# Altium schematic sheet VCA.SchDoc
size A2; SheetNumber: 1; SheetTotal: 1
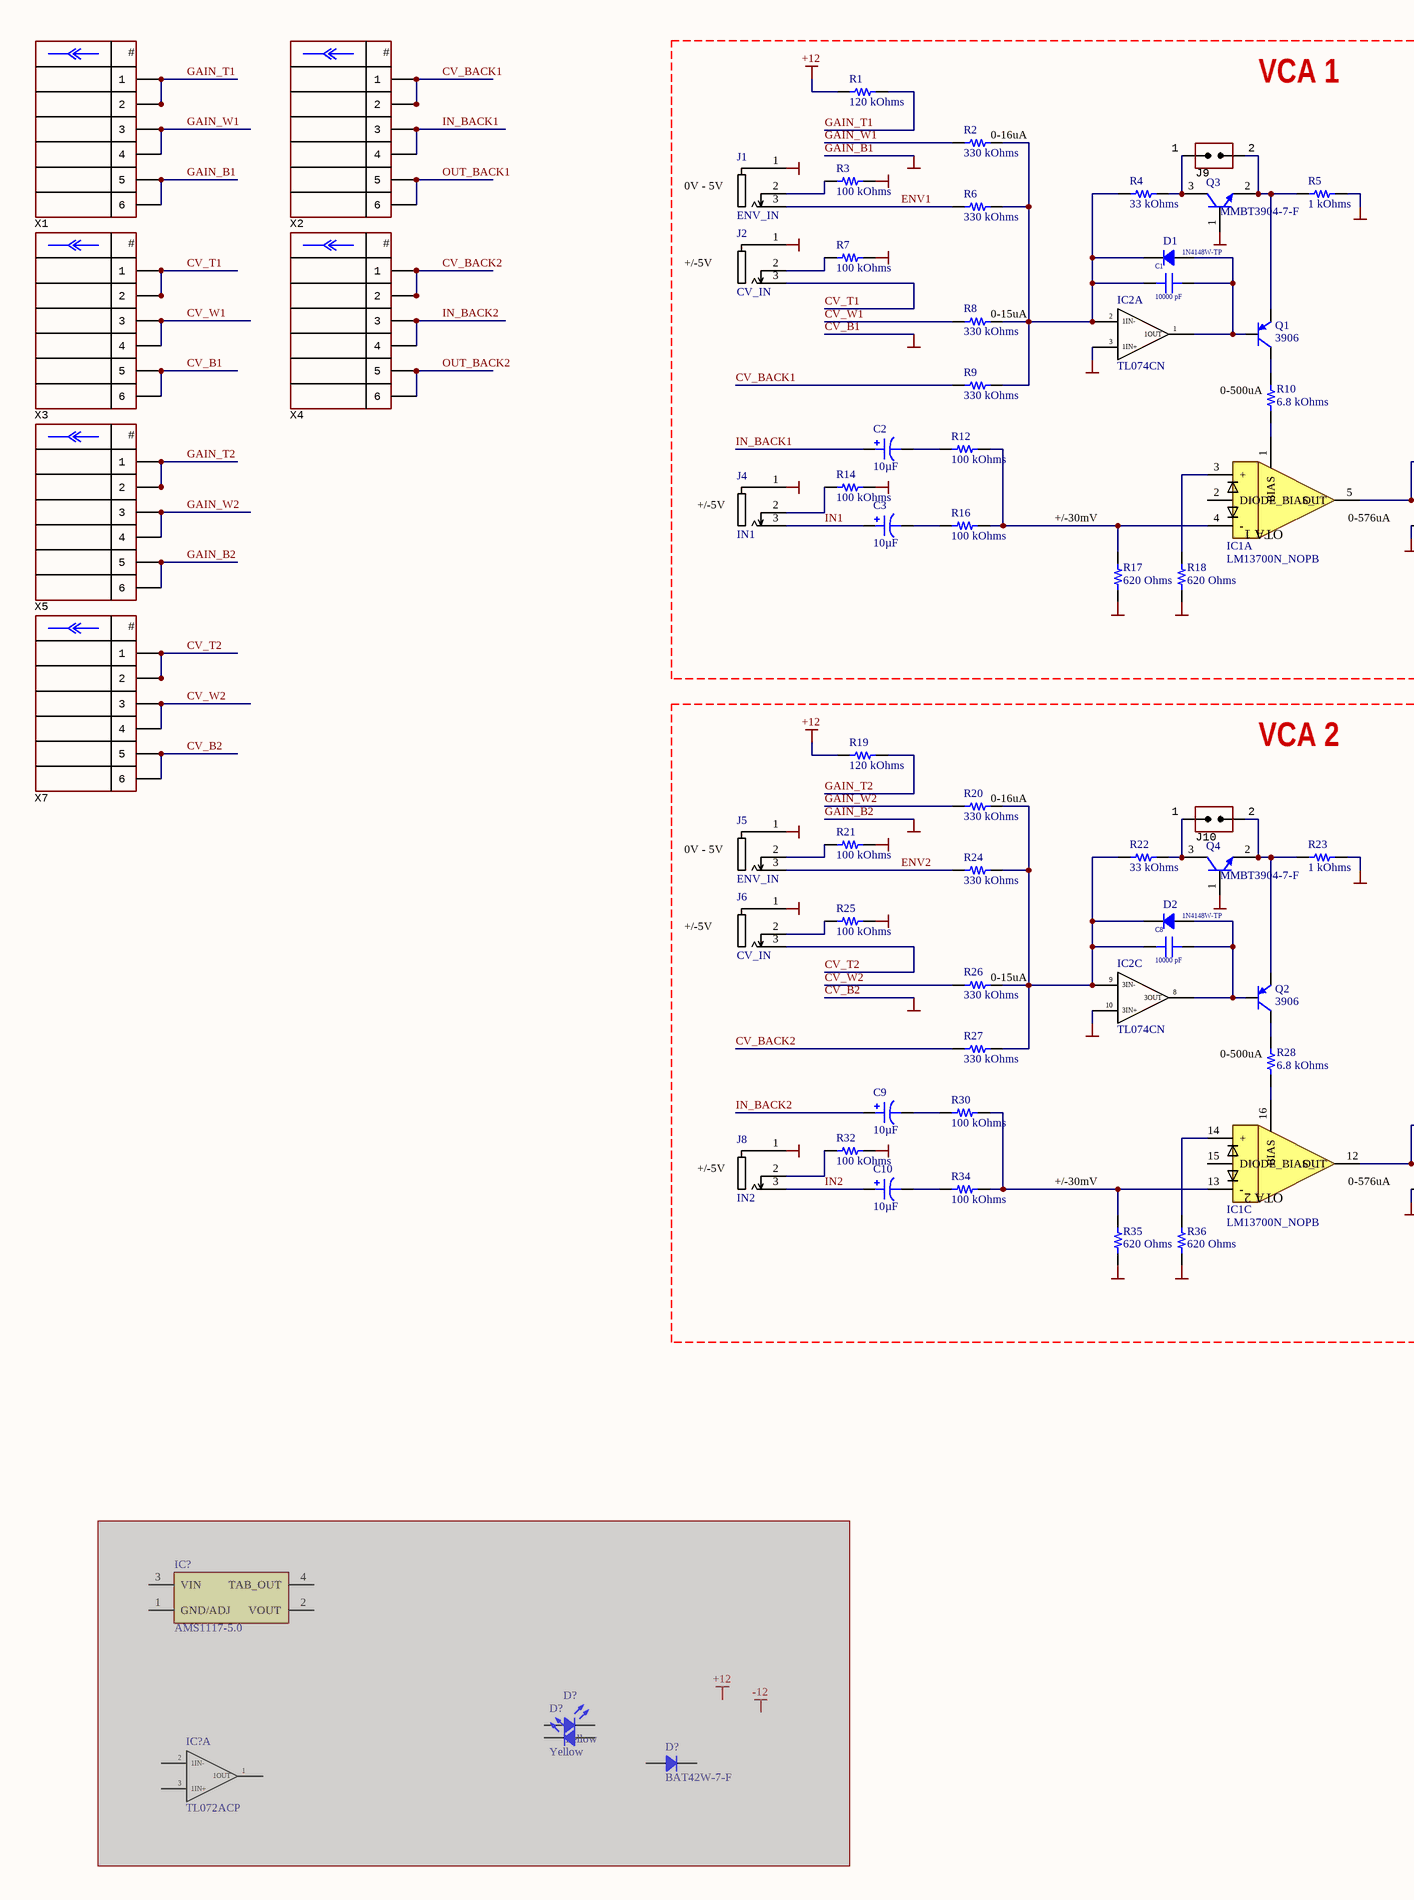
[diagram p0: VCA.SchDoc, left]
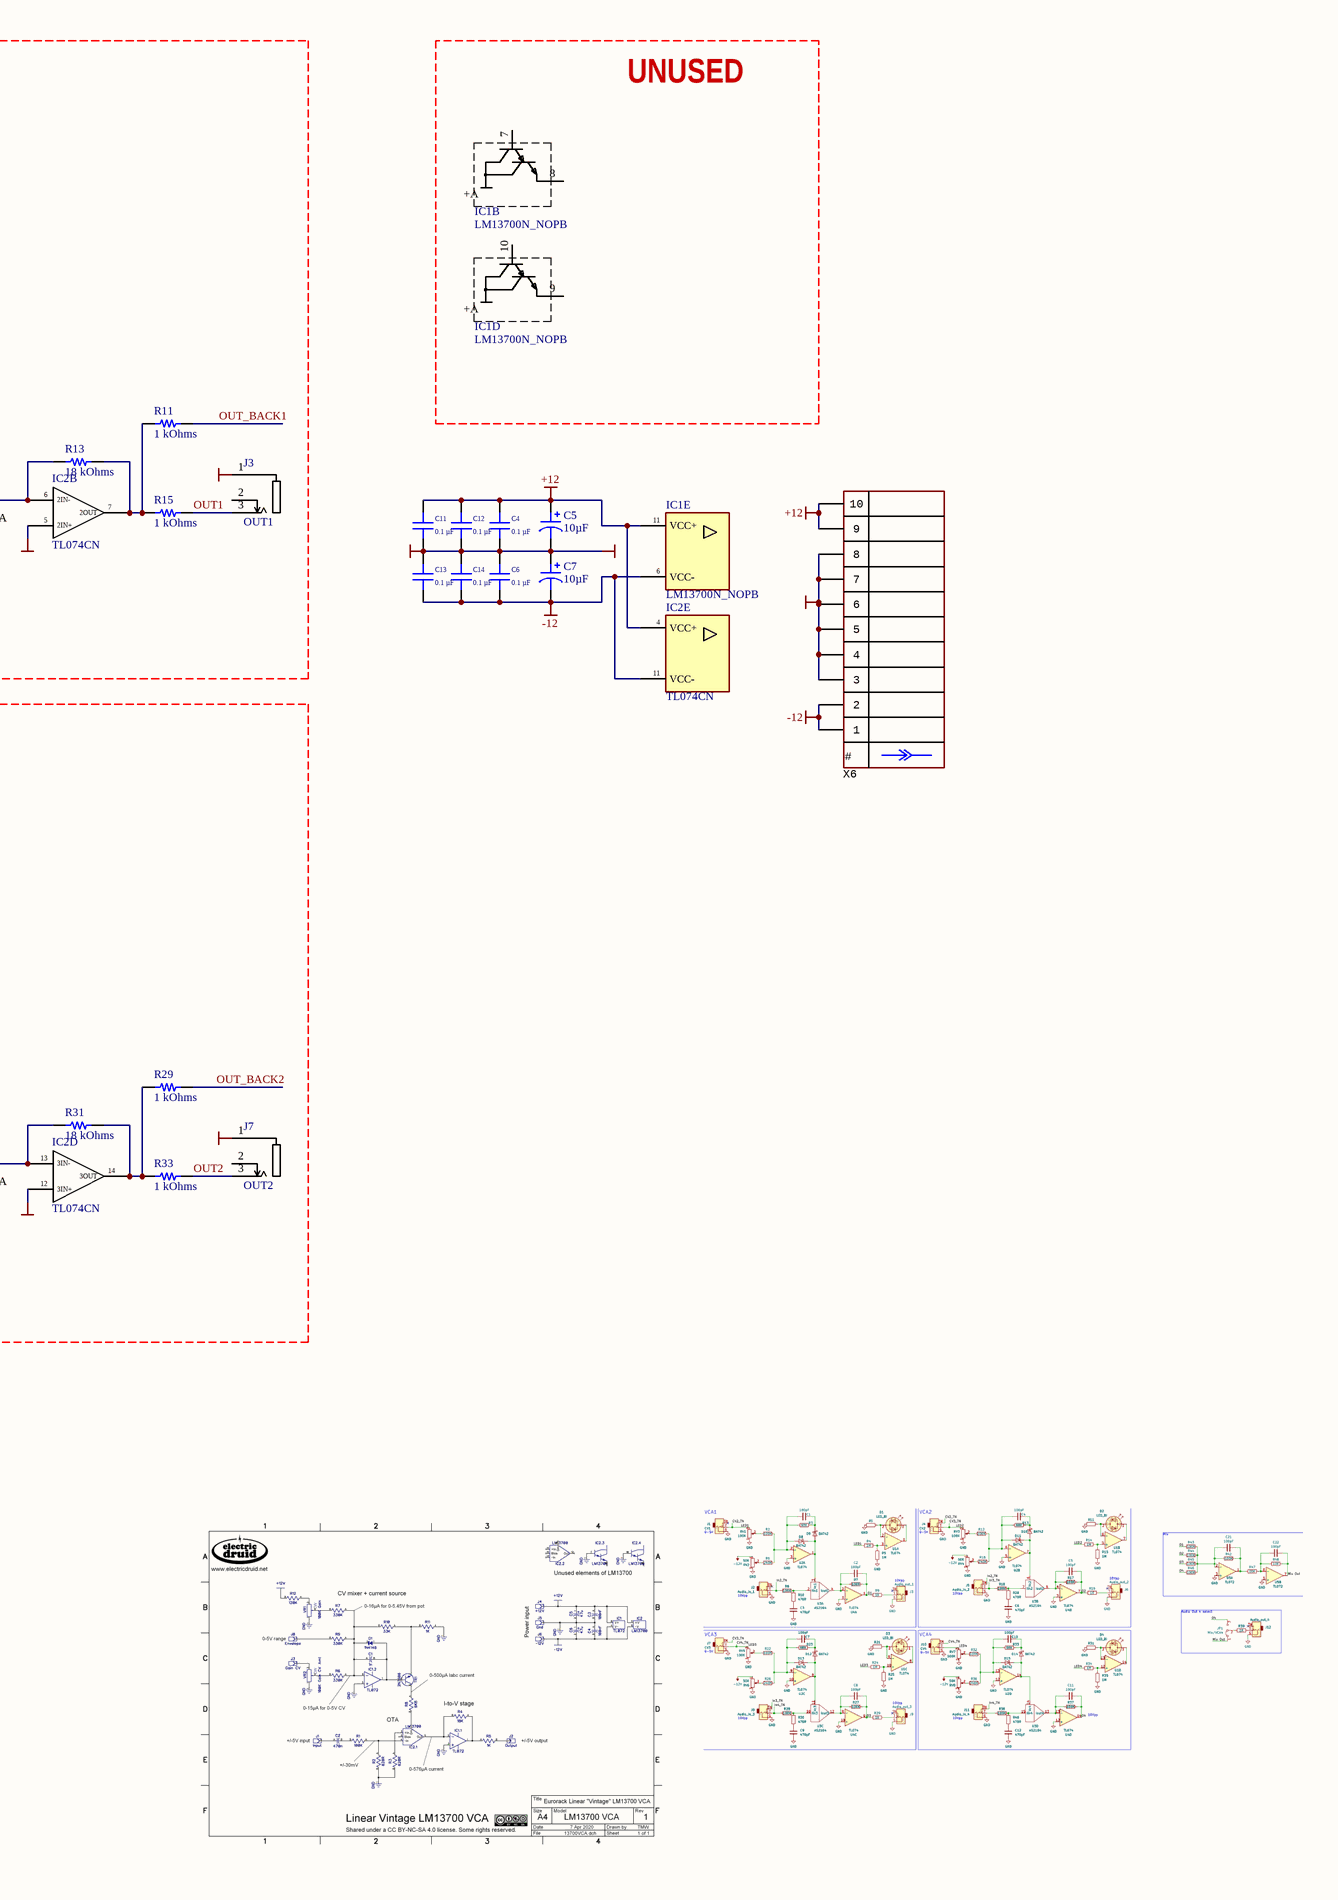
[diagram p1: VCA.SchDoc, right]

## Parts
(Parts that share a designator on the sheet are numbered #1, #2 ... from top to bottom, then left to right.)
C1  10000 pF  [MURATA GRM188 0603_1608]
C2  10µF  [CAP POL 1411_3528]
C3  10µF  [CAP POL 1411_3528]
C4  0.1 µF  [CAP 0603_1608]
C5  10µF  [CAP POL 1411_3528]
C6  0.1 µF  [CAP 0603_1608]
C7  10µF  [CAP POL 1411_3528]
C8  10000 pF  [MURATA GRM188 0603_1608]
C9  10µF  [CAP POL 1411_3528]
C10  10µF  [CAP POL 1411_3528]
C11  0.1 µF  [CAP 0603_1608]
C12  0.1 µF  [CAP 0603_1608]
C13  0.1 µF  [CAP 0603_1608]
C14  0.1 µF  [CAP 0603_1608]
D1  1N4148W-TP  [SOD-123]
D2  1N4148W-TP  [SOD-123]
D?#1  Yellow  [LED 0805_2012 YELLOW]  (masked out: inside a compile mask, not in the netlist)
D?#2  Yellow  [LED 0805_2012 YELLOW]  (masked out: inside a compile mask, not in the netlist)
D?#3  BAT42W-7-F  [SOD-123]  (masked out: inside a compile mask, not in the netlist)
IC1  LM13700N_NOPB  [DIP_SMD-16]  (parts A,B,C,D,E of 5)
IC2  TL074CN  [DIP_SMD-14]  (parts A,B,C,D,E of 5)
IC?#1  AMS1117-5.0  [SOT-223]  (masked out: inside a compile mask, not in the netlist)
IC?#2  TL072ACP  [SOIC-8]  (part A of 3)  (masked out: inside a compile mask, not in the netlist)
J1  ENV_IN  [THONKICONN]
J2  CV_IN  [THONKICONN]
J3  OUT1  [THONKICONN]
J4  IN1  [THONKICONN]
J5  ENV_IN  [THONKICONN]
J6  CV_IN  [THONKICONN]
J7  OUT2  [THONKICONN]
J8  IN2  [THONKICONN]
J9  (no value)  [CON: JUMPER x1]
J10  (no value)  [CON: JUMPER x1]
Q1  3906  [SOT-23]
Q2  3906  [SOT-23]
Q3  MMBT3904-7-F  [DIODES SOT-23-3]
Q4  MMBT3904-7-F  [DIODES SOT-23-3]
R1  120 kOhms  [YAGEO RES 0603_1608]
R2  330 kOhms  [YAGEO RES 0603_1608]
R3  100 kOhms  [YAGEO RES 0603_1608]
R4  33 kOhms  [YAGEO RES 0603_1608]
R5  1 kOhms  [YAGEO RES 0603_1608]
R6  330 kOhms  [YAGEO RES 0603_1608]
R7  100 kOhms  [YAGEO RES 0603_1608]
R8  330 kOhms  [YAGEO RES 0603_1608]
R9  330 kOhms  [YAGEO RES 0603_1608]
R10  6.8 kOhms  [YAGEO RES 0603_1608]
R11  1 kOhms  [YAGEO RES 0603_1608]
R12  100 kOhms  [YAGEO RES 0603_1608]
R13  18 kOhms  [YAGEO RES 0603_1608]
R14  100 kOhms  [YAGEO RES 0603_1608]
R15  1 kOhms  [YAGEO RES 0603_1608]
R16  100 kOhms  [YAGEO RES 0603_1608]
R17  620 Ohms  [YAGEO RES 0603_1608]
R18  620 Ohms  [YAGEO RES 0603_1608]
R19  120 kOhms  [YAGEO RES 0603_1608]
R20  330 kOhms  [YAGEO RES 0603_1608]
R21  100 kOhms  [YAGEO RES 0603_1608]
R22  33 kOhms  [YAGEO RES 0603_1608]
R23  1 kOhms  [YAGEO RES 0603_1608]
R24  330 kOhms  [YAGEO RES 0603_1608]
R25  100 kOhms  [YAGEO RES 0603_1608]
R26  330 kOhms  [YAGEO RES 0603_1608]
R27  330 kOhms  [YAGEO RES 0603_1608]
R28  6.8 kOhms  [YAGEO RES 0603_1608]
R29  1 kOhms  [YAGEO RES 0603_1608]
R30  100 kOhms  [YAGEO RES 0603_1608]
R31  18 kOhms  [YAGEO RES 0603_1608]
R32  100 kOhms  [YAGEO RES 0603_1608]
R33  1 kOhms  [YAGEO RES 0603_1608]
R34  100 kOhms  [YAGEO RES 0603_1608]
R35  620 Ohms  [YAGEO RES 0603_1608]
R36  620 Ohms  [YAGEO RES 0603_1608]
X1  (no value)  [CON: PBD-6]
X2  (no value)  [CON: PBD-6]
X3  (no value)  [CON: PBD-6]
X4  (no value)  [CON: PBD-6]
X5  (no value)  [CON: PBD-6]
X6  (no value)  [CON: IDC-10MS]
X7  (no value)  [CON: PBD-6]

## Blocks framed on the sheet
VCA 1: C1-C3 D1 IC1 IC2 J1-J4 J9 Q1 Q3 R1-R18
UNUSED: IC1
VCA 2: C8-C10 D2 IC1 IC2 J5-J8 J10 Q2 Q4 R19-R36

## Nets
+12: C4.2 C5.1 C11.2 C12.2 IC1.11(VCC+) IC2.4(VCC+) R1.1 R19.1 X6.9 X6.10
-12: C6.1 C7.2 C13.1 C14.1 IC1.6(VCC-) IC2.11(VCC-) X6.1 X6.2
CV_B1: C4.1 C5.2 C6.2 C7.1 C11.1 C12.1 C13.2 C14.2 IC2.3(1IN+) IC2.5(2IN+) IC2.10(3IN+) IC2.12(3IN+) J1.1 J2.1 J3.1 J4.1 J5.1 J6.1 J7.1 J8.1 Q3.1(B) Q4.1(B) R3.2 R5.2 R7.2 R14.2 R17.1 R18.1 R21.2 R23.2 R25.2 R32.2 R35.1 R36.1 X1.5 X1.6 X3.5 X3.6 X5.5 X5.6 X6.3 X6.4 X6.5 X6.6 X6.7 X6.8 X7.5 X7.6  [also labelled CV_B2, GAIN_B1, GAIN_B2, GND]
CV_BACK1: R9.1 X2.1 X2.2
CV_BACK2: R27.1 X4.1 X4.2
CV_T1: J2.3 X3.1 X3.2
CV_T2: J6.3 X7.1 X7.2
CV_W1: R8.1 X3.3 X3.4
CV_W2: R26.1 X7.3 X7.4
ENV1: J1.3 R6.1
ENV2: J5.3 R24.1
GAIN_T1: R1.2 X1.1 X1.2
GAIN_T2: R19.2 X5.1 X5.2
GAIN_W1: R2.1 X1.3 X1.4
GAIN_W2: R20.1 X5.3 X5.4
IN1: C3.1 J4.3
IN2: C10.1 J8.3
IN_BACK1: C2.1 X2.3 X2.4
IN_BACK2: C9.1 X4.3 X4.4
OUT1: J3.3 R15.2
OUT2: J7.3 R33.2
OUT_BACK1: R11.2 X2.5 X2.6
OUT_BACK2: R29.2 X4.5 X4.6
NetC1_1: C1.1 D1.1 IC2.1(1OUT) Q1.1(B)
NetC1_2: C1.2 D1.2 IC2.2(1IN-) R2.2 R4.1 R6.2 R8.2 R9.2
NetC2_2: C2.2 R12.1
NetC3_2: C3.2 R16.1
NetC8_1: C8.1 D2.1 IC2.8(3OUT) Q2.1(B)
NetC8_2: C8.2 D2.2 IC2.9(3IN-) R20.2 R22.1 R24.2 R26.2 R27.2
NetC9_2: C9.2 R30.1
NetC10_2: C10.2 R34.1
NetIC1_1: IC1.1(BIAS) R10.1
NetIC1_3: IC1.3(+) R18.2
NetIC1_4: IC1.4(-) R12.2 R16.2 R17.2
NetIC1_5: IC1.5(OUT) IC2.6(2IN-) R13.1
NetIC1_12: IC1.12(OUT) IC2.13(3IN-) R31.1
NetIC1_13: IC1.13(-) R30.2 R34.2 R35.2
NetIC1_14: IC1.14(+) R36.2
NetIC1_16: IC1.16(BIAS) R28.1
NetIC2_7: IC2.7(2OUT) R11.1 R13.2 R15.1
NetIC2_14: IC2.14(3OUT) R29.1 R31.2 R33.1
NetJ1_2: J1.2 R3.1
NetJ2_2: J2.2 R7.1
NetJ4_2: J4.2 R14.1
NetJ5_2: J5.2 R21.1
NetJ6_2: J6.2 R25.1
NetJ8_2: J8.2 R32.1
NetJ9_1: J9.1(IN) Q3.3(C) R4.2
NetJ9_2: J9.2(IN) Q1.2(E) Q3.2(E) R5.1
NetJ10_1: J10.1(IN) Q4.3(C) R22.2
NetJ10_2: J10.2(IN) Q2.2(E) Q4.2(E) R23.1
NetQ1_3: Q1.3(C) R10.2
NetQ2_3: Q2.3(C) R28.2

Not connected (* = marked no-connect by the designer): IC1 2(DIODE_BIAS_1) 7(BUFFER_INPUT_1) 8(BUFFER_OUTPUT_1) 9(BUFFER_OUTPUT_1) 10(BUFFER_INPUT_1) 15(DIODE_BIAS_1); J3 2(4); J7 2(4)

## Notes on the sheet
- (near J1) 0V - 5V
- (near R2) 0-16uA
- +/-5V
- (near R8) 0-15uA
- (near R10) 0-500uA
- (near J4) +/-5V
- (near R17) +/-30mV
- (near IC1) 0-576uA
- (near R20) 0-16uA
- (near J5) 0V - 5V
- (near R26) 0-15uA
- (near R28) 0-500uA
- (near J8) +/-5V
- (near R35) +/-30mV
- (in symbol IDC-10) #
- (in symbol LM13700N_NOPB, part A) OTA 1
- (in symbol LM13700N_NOPB, part B) V+
- (in symbol LM13700N_NOPB, part C) OTA 2
- (in symbol LM13700N_NOPB, part D) V+
- (in symbol PBD-6) #

## Library data of the parts
C1 C8 = GRM1885C1H103JA01D: CAP CER 10000PF 50V C0G/NP0 0603; manufacturer: Murata Electronics; Temperature Coefficient: C0G, NP0; Tolerance: ±5%; Part Number: GRM1885C1H103JA01D; Capacitance: 10000 pF; Applications: General Purpose; componentlink1description: Datasheet; componentlink1url: https://www.murata.com/~/media/webrenewal/support/library/catalog/products/capacitor/mlcc/c02e.ashx?la=en-us; componentlink2description: DigiKey Link; componentlink2url: https://www.digikey.com/en/products/detail/murata-electronics/GRM1885C1H103JA01D/4421555; Device Package: 0603 (1608 Metric); lastupdated: 7/20/2024 12:23:21 AM; Lifecycle Status: Active; Minimum Order: 1; Mounting Type: Surface Mount, MLCC; Operating Temperature: -55°C ~ 125°C; Package / Case: 0603 (1608 Metric); packaging: TapeAndReel; partid: 11077; Part Status: Active; price: 0.02; series: GRM; Size / Dimension: 0.063" L x 0.031" W (1.60mm x 0.80mm); Supplier 1: DigiKey; Supplier Part Number 1: 490-9666-1-ND; Thickness (Max): 0.035" (0.90mm); value: 10000 pF; Voltage - Rated: 50V
C2 C3 C5 C7 C9 C10 = TAJB106K025RNJ: CAP TANT 10UF 10% 25V 1411; manufacturer: AVX Corporation; Manufacturer Size Code: B; ESR (Equivalent Series Resistance): 2.5Ohm; Type: Molded; Part Number: TAJB106K025RNJ; Value: 10µF; Capacitance: 10µF; componentlink1description: Datasheet; componentlink1url: http://datasheets.avx.com/TAJ.pdf; componentlink2description: DigiKey Link; componentlink2url: http://digikey.com/product-detail/en/avx-corporation/TAJB106K025RNJ/478-5257-1-ND/1950924; Features: General Purpose; Height - Seated (Max): 0.083" (2.10mm); lastupdated: 9/2/2020 1:15:45 AM; Lifecycle Status: Active; Minimum Order: 1; Mounting Type: Surface Mount; Operating Temperature: -55°C ~ 125°C; Package / Case: 1411 (3528 Metric), 1210; packaging: TapeAndReel; partid: 206; Part Status: Active; price: 0.16; series: TAJ; Size / Dimension: 0.138" L x 0.110" W (3.50mm x 2.80mm); Supplier 1: DigiKey; Supplier Part Number 1: 478-5257-1-ND; Tolerance: ±10%; Voltage - Rated: 25V
C4 C6 C11-C14 = C0603C104K5RAC7411: CAP CER 0.1UF 50V X7R 0603; manufacturer: KEMET; Tolerance: ±10%; Part Number: C0603C104K5RAC7411; Value: 0.1 µF; Applications: Bypass, Decoupling; Capacitance: 0.1 µF; componentlink1description: Datasheet; componentlink1url: https://api.kemet.com/component-edge/download/datasheet/C0603C104K5RAC7411.pdf; componentlink2description: DigiKey Link; componentlink2url: https://www.digikey.com/en/products/detail/kemet/C0603C104K5RAC7411/3317013; Device Package: 0603 (1608 Metric); lastupdated: 2/9/2024 8:10:30 PM; Lifecycle Status: Active; Minimum Order: 1; Mounting Type: Surface Mount, MLCC; Operating Temperature: -55°C ~ 125°C; Package / Case: 0603 (1608 Metric); packaging: TapeAndReel; partid: 2233; Part Status: Active; price: 0.01; series: SMD Comm X7R; Size / Dimension: 0.063" L x 0.031" W (1.60mm x 0.80mm); Supplier 1: DigiKey; Supplier Part Number 1: 399-C0603C104K5RAC7411CT-ND; Temperature Coefficient: X7R; Thickness (Max): 0.035" (0.90mm); Voltage - Rated: 50V
D1 D2 = 1N4148W-TP: DIODE GEN PURP 100V 150MA SOD123; Manufacturer: Micro Commercial Co; Capacitance @ Vr, F: 2pF @ 0V, 1MHz; Current - Reverse Leakage @ Vr: 1 µA @ 75 V; Diode Type: Standard; Reverse Recovery Time (trr): 4 ns; Speed: Small Signal =< 200mA (Io), Any Speed; Voltage - Forward (Vf) (Max) @ If: 1.25 V @ 150 mA; Part Number: 1N4148W-TP; ComponentLink1Description: Datasheet; ComponentLink1URL: https://www.mccsemi.com/pdf/Products/1N4148W(SOD123).pdf; ComponentLink2Description: DigiKey Link; ComponentLink2URL: https://www.digikey.com/en/products/detail/micro-commercial-co/1N4148W-TP/717196; Current - Average Rectified (Io): 150mA; LastUpdated: 6/3/2024 7:54:46 PM; Lifecycle Status: Active; Minimum Order: 1; Mounting Type: Surface Mount; Operating Temperature - Junction: -65°C ~ 150°C; Package / Case: SOD-123; Packaging: TapeAndReel; PartId: 999; Part Status: Active; Price: 0.01; Series: -; Supplier 1: DigiKey; Supplier Part Number 1: 1N4148WTPMSCT-ND; Supplier Device Package: SOD-123; Voltage - DC Reverse (Vr) (Max): 100 V
D?#1 D?#2 = SML-LX0805YC-TR: LED YELLOW CLEAR SMD; Manufacturer: Lumex Opto/Components Inc.; Configuration: Standard; Current - Test: 20mA; Lens Color: Colorless; Lens Size: 1.40mm x 1.25mm; Lens Style: Rectangle with Flat Top; Millicandela Rating: 9mcd; Viewing Angle: 140°; Voltage - Forward (Vf) (Typ): 2.1V; Wavelength - Peak: 585nm; Part Number: SML-LX0805YC-TR; Color: Yellow; ComponentLink1Description: Datasheet; ComponentLink1URL: https://www.lumex.com/content/files/ProductAttachment/SML-LX0805YC-TR.pdf; ComponentLink2Description: DigiKey Link; ComponentLink2URL: https://www.digikey.com/en/products/detail/lumex-opto-components-inc/SML-LX0805YC-TR/515791; Device Package: 0805 (2012 Metric); Height (Max): 1.20mm; LastUpdated: 6/3/2024 8:01:27 PM; Lens Transparency: Clear; Lifecycle Status: Active; Minimum Order: 1; Mounting Type: Surface Mount; Package / Case: 0805 (2012 Metric); Packaging: TapeAndReel; PartId: 39; Part Status: Active; Price: 0.04; Series: -; Size / Dimension: 2.00mm L x 1.25mm W; Supplier 1: DigiKey; Supplier Part Number 1: 67-2192-1-ND; Value: Yellow
D?#3 = BAT42W-7-F: DIODE SCHOTTKY 30V 200MA SOD123; Manufacturer: Diodes Incorporated; Capacitance @ Vr, F: 10pF @ 1V, 1MHz; Current - Reverse Leakage @ Vr: 500 nA @ 25 V; Reverse Recovery Time (trr): 5 ns; Speed: Small Signal =< 200mA (Io), Any Speed; Voltage - Forward (Vf) (Max) @ If: 1 V @ 200 mA; Part Number: BAT42W-7-F; ComponentLink1Description: Datasheet; ComponentLink1URL: //media.digikey.com/pdf/Data%20Sheets/Diodes%20PDFs/BAT42W%20-BAT43W.pdf; ComponentLink2Description: DigiKey Link; ComponentLink2URL: https://www.digikey.com/en/products/detail/diodes-incorporated/BAT42W-7-F/674603; Current - Average Rectified (Io): 200mA; Diode Type: Schottky; LastUpdated: 6/3/2024 7:54:46 PM; Lifecycle Status: Active; Minimum Order: 1; Mounting Type: Surface Mount; Operating Temperature - Junction: -55°C ~ 125°C; Package / Case: SOD-123; Packaging: TapeAndReel; PartId: 2233; Part Status: Active; Price: 0.04; Series: -; Supplier 1: DigiKey; Supplier Part Number 1: BAT42W-FDICT-ND; Supplier Device Package: SOD-123; Voltage - DC Reverse (Vr) (Max): 30 V
IC1 = LM13700N_NOPB: Integrated Circuit; Manufacturer_Name: Texas Instruments; Manufacturer_Part_Number: LM13700N/NOPB; Datasheet Link: http://www.ti.com/lit/ds/symlink/lm13700.pdf; Height: 4.318mm; Mouser Part Number: 926-LM13700N/NOPB; Mouser Price/Stock: https://www.mouser.co.uk/ProductDetail/Texas-Instruments/LM13700N-NOPB?qs=X1J7HmVL2ZFKw9D7azZDXw%3D%3D; Arrow Part Number: LM13700N/NOPB; Arrow Price/Stock: https://www.arrow.com/en/products/lm13700nnopb/texas-instruments?region=nac
IC2 = TL074CN: Integrated Circuit; Manufacturer_Name: Texas Instruments; Datasheet Link: https://www.ti.com/lit/ds/symlink/tl074.pdf?HQS=TI-null-null-mousermode-df-pf-null-wwe&ts=1598513500878&ref_url=https%253A%252F%252Feu.mouser.com%252F; Height: 5.08mm; Manufacturer_Part_Number: TL074CN; Mouser Part Number: 595-TL074CN; Mouser Price/Stock: https://www.mouser.co.uk/ProductDetail/Texas-Instruments/TL074CN?qs=AMJt07B76uv7dLYnj7iLiQ%3D%3D; Arrow Part Number: TL074CN; Arrow Price/Stock: https://www.arrow.com/en/products/tl074cn/texas-instruments?utm_currency=USD&region=nac
IC?#1 = AMS1117-5.0: Integrated Circuit; Manufacturer_Name: Advanced Monolithic Systems; Datasheet Link: http://www.advanced-monolithic.com/pdf/ds1117.pdf; Height: 1.8mm; Manufacturer_Part_Number: AMS1117-5.0
IC?#2 = TL072ACP: Integrated Circuit; Manufacturer_Name: Texas Instruments; Datasheet Link: http://www.ti.com/lit/ds/symlink/tl071a.pdf; Height: 5.08mm; Manufacturer_Part_Number: TL072ACP; Mouser Part Number: 595-TL072ACP; Mouser Price/Stock: https://www.mouser.co.uk/ProductDetail/Texas-Instruments/TL072ACP?qs=0OT4q4QBUTLFvIZ%252B%2FvrwoQ%3D%3D; Arrow Part Number: TL072ACP; Arrow Price/Stock: https://www.arrow.com/en/products/tl072acp/texas-instruments?utm_currency=USD&region=europe
J1-J8 = PJ-301M-3P: THONKICONN metal
J9 J10 = Jumper_single: CommentText: "Перемычка"
Q1 Q2 = MMBT3906
Q3 Q4 = MMBT3904-7-F: TRANS NPN 40V 0.2A SOT23-3; Manufacturer: Diodes Incorporated; Current - Collector Cutoff (Max): 50nA (ICBO); Current - Collector (Ic) (Max): 200 mA; DC Current Gain (hFE) (Min) @ Ic, Vce: 100 @ 10mA, 1V; Frequency - Transition: 300MHz; Power - Max: 300 mW; Vce Saturation (Max) @ Ib, Ic: 300mV @ 5mA, 50mA; Part Number: MMBT3904-7-F; ComponentLink1Description: Datasheet; ComponentLink1URL: https://www.diodes.com/assets/Datasheets/ds30036.pdf; ComponentLink2Description: DigiKey Link; ComponentLink2URL: https://www.digikey.com/en/products/detail/diodes-incorporated/MMBT3904-7-F/814494; LastUpdated: 2/8/2024 9:54:04 PM; Lifecycle Status: Active; Minimum Order: 1; Mounting Type: Surface Mount; Operating Temperature: -55°C ~ 150°C (TJ); Package / Case: TO-236-3, SC-59, SOT-23-3; Packaging: TapeAndReel; PartId: 85; Part Status: Active; Price: 0.01; Series: -; Supplier 1: DigiKey; Supplier Part Number 1: MMBT3904-FDICT-ND; Supplier Device Package: SOT-23-3; Transistor Type: NPN; Voltage - Collector Emitter Breakdown (Max): 40 V
R1 R19 = AC0603FR-07120KL: RES SMD 120K OHM 1% 1/10W 0603; Manufacturer: Yageo; Power (Watts): 0.1W, 1/10W; Temperature Coefficient: ±100ppm/°C; Part Number: AC0603FR-07120KL; Value: 120 kOhms; ComponentLink1Description: Datasheet; ComponentLink1URL: https://www.yageo.com/upload/media/product/productsearch/datasheet/rchip/PYu-AC_51_RoHS_L_7.pdf; ComponentLink2Description: DigiKey Link; ComponentLink2URL: https://www.digikey.com/en/products/detail/yageo/AC0603FR-07120KL/5895760; Composition: Thick Film; Device Package: 0603 (1608 Metric); Features: Automotive AEC-Q200, Moisture Resistant; Height - Seated (Max): 0.022" (0.55mm); LastUpdated: 7/25/2024 9:19:23 AM; Lifecycle Status: Active; Minimum Order: 1; Number of Terminations: 2; Operating Temperature: -55°C ~ 155°C; Package / Case: 0603 (1608 Metric); Packaging: CutTape; PartId: 17461; Part Status: Active; Price: 0.01; Ratings: AEC-Q200; Resistance: 120 kOhms; Series: AC; Size / Dimension: 0.063" L x 0.031" W (1.60mm x 0.80mm); Supplier 1: DigiKey; Supplier Part Number 1: YAG3562CT-ND; Supplier Device Package: 0603; Tolerance: ±1%
R2 R6 R8 R9 R20 R24 R26 R27 = AC0603FR-07330KL: RES SMD 330K OHM 1% 1/10W 0603; Manufacturer: Yageo; Power (Watts): 0.1W, 1/10W; Temperature Coefficient: ±100ppm/°C; Part Number: AC0603FR-07330KL; Value: 330 kOhms; ComponentLink1Description: Datasheet; ComponentLink1URL: https://www.yageo.com/upload/media/product/productsearch/datasheet/rchip/PYu-AC_51_RoHS_L_7.pdf; ComponentLink2Description: DigiKey Link; ComponentLink2URL: https://www.digikey.com/en/products/detail/yageo/AC0603FR-07330KL/5896036; Composition: Thick Film; Device Package: 0603 (1608 Metric); Features: Automotive AEC-Q200, Moisture Resistant; Height - Seated (Max): 0.022" (0.55mm); LastUpdated: 7/25/2024 9:19:23 AM; Lifecycle Status: Active; Minimum Order: 1; Number of Terminations: 2; Operating Temperature: -55°C ~ 155°C; Package / Case: 0603 (1608 Metric); Packaging: CutTape; PartId: 17469; Part Status: Active; Price: 0.01; Ratings: AEC-Q200; Resistance: 330 kOhms; Series: AC; Size / Dimension: 0.063" L x 0.031" W (1.60mm x 0.80mm); Supplier 1: DigiKey; Supplier Part Number 1: YAG3594CT-ND; Supplier Device Package: 0603; Tolerance: ±1%
R3 R7 R12 R14 R16 R21 R25 R30 R32 R34 = AA0603FR-07100KL: RES SMD 100K OHM 1% 1/10W 0603; Manufacturer: Yageo; Power (Watts): 0.1W, 1/10W; Temperature Coefficient: ±150ppm/°C; Part Number: AA0603FR-07100KL; Value: 100 kOhms; ComponentLink1Description: Datasheet; ComponentLink1URL: https://www.yageo.com/upload/media/product/productsearch/datasheet/rchip/PYu-AA_51_RoHS_L_3.pdf; ComponentLink2Description: DigiKey Link; ComponentLink2URL: https://www.digikey.com/en/products/detail/yageo/AA0603FR-07100KL/5888687; Composition: Thick Film; Device Package: 0603 (1608 Metric); Features: Anti-Sulfur, Automotive AEC-Q200, Moisture Resistant; Height - Seated (Max): 0.022" (0.55mm); LastUpdated: 7/25/2024 9:19:03 AM; Lifecycle Status: Active; Minimum Order: 1; Number of Terminations: 2; Operating Temperature: -55°C ~ 155°C; Package / Case: 0603 (1608 Metric); Packaging: TapeAndReel; PartId: 78895; Price: 0.01; Ratings: AEC-Q200; Resistance: 100 kOhms; Series: AA; Size / Dimension: 0.063" L x 0.031" W (1.60mm x 0.80mm); Supplier 1: DigiKey; Supplier Part Number 1: 13-AA0603FR-07100KLCT-ND; Supplier Device Package: 0603; Tolerance: ±1%
R4 R22 = AC0603FR-0733KL: RES SMD 33K OHM 1% 1/10W 0603; Manufacturer: Yageo; Power (Watts): 0.1W, 1/10W; Temperature Coefficient: ±100ppm/°C; Part Number: AC0603FR-0733KL; Value: 33 kOhms; ComponentLink1Description: Datasheet; ComponentLink1URL: https://www.yageo.com/upload/media/product/productsearch/datasheet/rchip/PYu-AC_51_RoHS_L_7.pdf; ComponentLink2Description: DigiKey Link; ComponentLink2URL: https://www.digikey.com/en/products/detail/yageo/AC0603FR-0733KL/5896041; Composition: Thick Film; Device Package: 0603 (1608 Metric); Features: Automotive AEC-Q200, Moisture Resistant; Height - Seated (Max): 0.022" (0.55mm); LastUpdated: 7/25/2024 9:19:23 AM; Lifecycle Status: Active; Minimum Order: 1; Number of Terminations: 2; Operating Temperature: -55°C ~ 155°C; Package / Case: 0603 (1608 Metric); Packaging: CutTape; PartId: 17385; Part Status: Active; Price: 0.01; Ratings: AEC-Q200; Resistance: 33 kOhms; Series: AC; Size / Dimension: 0.063" L x 0.031" W (1.60mm x 0.80mm); Supplier 1: DigiKey; Supplier Part Number 1: YAG3598CT-ND; Supplier Device Package: 0603; Tolerance: ±1%
R5 R11 R15 R23 R29 R33 = AA0603FR-071KL: RES SMD 1K OHM 1% 1/10W 0603; Manufacturer: Yageo; Power (Watts): 0.1W, 1/10W; Temperature Coefficient: ±150ppm/°C; Part Number: AA0603FR-071KL; Value: 1 kOhms; ComponentLink1Description: Datasheet; ComponentLink1URL: https://www.yageo.com/upload/media/product/productsearch/datasheet/rchip/PYu-AA_51_RoHS_L_3.pdf; ComponentLink2Description: DigiKey Link; ComponentLink2URL: https://www.digikey.com/en/products/detail/yageo/AA0603FR-071KL/5888847; Composition: Thick Film; Device Package: 0603 (1608 Metric); Features: Anti-Sulfur, Automotive AEC-Q200, Moisture Resistant; Height - Seated (Max): 0.022" (0.55mm); LastUpdated: 7/25/2024 9:19:15 AM; Lifecycle Status: Active; Minimum Order: 1; Number of Terminations: 2; Operating Temperature: -55°C ~ 155°C; Package / Case: 0603 (1608 Metric); Packaging: TapeAndReel; PartId: 64335; Part Status: Active; Price: 0.01; Ratings: AEC-Q200; Resistance: 1 kOhms; Series: AA; Size / Dimension: 0.063" L x 0.031" W (1.60mm x 0.80mm); Supplier 1: DigiKey; Supplier Part Number 1: 13-AA0603FR-071KLCT-ND; Supplier Device Package: 0603; Tolerance: ±1%
R10 R28 = AC0603FR-076K8L: RES SMD 6.8K OHM 1% 1/10W 0603; Manufacturer: Yageo; Power (Watts): 0.1W, 1/10W; Temperature Coefficient: ±100ppm/°C; Part Number: AC0603FR-076K8L; Value: 6.8 kOhms; ComponentLink1Description: Datasheet; ComponentLink1URL: https://www.yageo.com/upload/media/product/productsearch/datasheet/rchip/PYu-AC_51_RoHS_L_7.pdf; ComponentLink2Description: DigiKey Link; ComponentLink2URL: https://www.digikey.com/en/products/detail/yageo/AC0603FR-076K8L/5896266; Composition: Thick Film; Device Package: 0603 (1608 Metric); Features: Automotive AEC-Q200, Moisture Resistant; Height - Seated (Max): 0.022" (0.55mm); LastUpdated: 7/25/2024 9:19:23 AM; Lifecycle Status: Active; Minimum Order: 1; Number of Terminations: 2; Operating Temperature: -55°C ~ 155°C; Package / Case: 0603 (1608 Metric); Packaging: CutTape; PartId: 17383; Part Status: Active; Price: 0.01; Ratings: AEC-Q200; Resistance: 6.8 kOhms; Series: AC; Size / Dimension: 0.063" L x 0.031" W (1.60mm x 0.80mm); Supplier 1: DigiKey; Supplier Part Number 1: YAG3627CT-ND; Supplier Device Package: 0603; Tolerance: ±1%
R13 R31 = AC0603FR-0718KL: RES SMD 18K OHM 1% 1/10W 0603; Manufacturer: Yageo; Power (Watts): 0.1W, 1/10W; Temperature Coefficient: ±100ppm/°C; Part Number: AC0603FR-0718KL; Value: 18 kOhms; ComponentLink1Description: Datasheet; ComponentLink1URL: https://www.yageo.com/upload/media/product/productsearch/datasheet/rchip/PYu-AC_51_RoHS_L_7.pdf; ComponentLink2Description: DigiKey Link; ComponentLink2URL: https://www.digikey.com/en/products/detail/yageo/AC0603FR-0718KL/5895836; Composition: Thick Film; Device Package: 0603 (1608 Metric); Features: Automotive AEC-Q200, Moisture Resistant; Height - Seated (Max): 0.022" (0.55mm); LastUpdated: 7/25/2024 9:19:23 AM; Lifecycle Status: Active; Minimum Order: 1; Number of Terminations: 2; Operating Temperature: -55°C ~ 155°C; Package / Case: 0603 (1608 Metric); Packaging: CutTape; PartId: 17436; Part Status: Active; Price: 0.01; Ratings: AEC-Q200; Resistance: 18 kOhms; Series: AC; Size / Dimension: 0.063" L x 0.031" W (1.60mm x 0.80mm); Supplier 1: DigiKey; Supplier Part Number 1: YAG3570CT-ND; Supplier Device Package: 0603; Tolerance: ±1%
R17 R18 R35 R36 = AC0603FR-07620RL: RES SMD 620 OHM 1% 1/10W 0603; Manufacturer: Yageo; Power (Watts): 0.1W, 1/10W; Temperature Coefficient: ±100ppm/°C; Part Number: AC0603FR-07620RL; Value: 620 Ohms; ComponentLink1Description: Datasheet; ComponentLink1URL: https://www.yageo.com/upload/media/product/productsearch/datasheet/rchip/PYu-AC_51_RoHS_L_8.pdf; ComponentLink2Description: DigiKey Link; ComponentLink2URL: https://www.digikey.com/en/products/detail/yageo/AC0603FR-07620RL/5896232; Composition: Thick Film; Device Package: 0603 (1608 Metric); Features: Automotive AEC-Q200, Moisture Resistant; Height - Seated (Max): 0.022" (0.55mm); LastUpdated: 7/25/2024 9:19:12 AM; Lifecycle Status: Active; Minimum Order: 1; Number of Terminations: 2; Operating Temperature: -55°C ~ 155°C; Package / Case: 0603 (1608 Metric); Packaging: CutTape; PartId: 62322; Part Status: Active; Price: 0.01; Ratings: AEC-Q200; Resistance: 620 Ohms; Series: AC; Size / Dimension: 0.063" L x 0.031" W (1.60mm x 0.80mm); Supplier 1: DigiKey; Supplier Part Number 1: 13-AC0603FR-07620RLCT-ND; Supplier Device Package: 0603; Tolerance: ±1%
X1-X5 X7 = PBD-6: Manufacturer: Connfly; ValueManufacturerPartNumber: Connector, 6pin, 2.54mm, 500VAC, 3A; TypeConnector: Connector; VoltageMax: 500VAC; Pitch: 2.54mm; CurrentMax: 3A; Multichannel: 6pin; CommentText: "Разъем"; HelpURL: https://www.chipdip.ru/product/pbd-6; PartNumber: PBD-6
X6 = IDC-10: Manufacturer: Connfly; ValueManufacturerPartNumber: Connector, 10pin, 2.54mm, 250VAC, 3A; TypeConnector: Connector; VoltageMax: 250VAC; Pitch: 2.54mm; CurrentMax: 3A; Multichannel: 10pin; CommentText: "Разъем"; HelpURL: https://www.chipdip.ru/product/idc-10ms; PartNumber: IDC-10